# Altium schematic sheet Sheet2.SchDoc
size A4; SheetNumber: 2; SheetTotal: 2
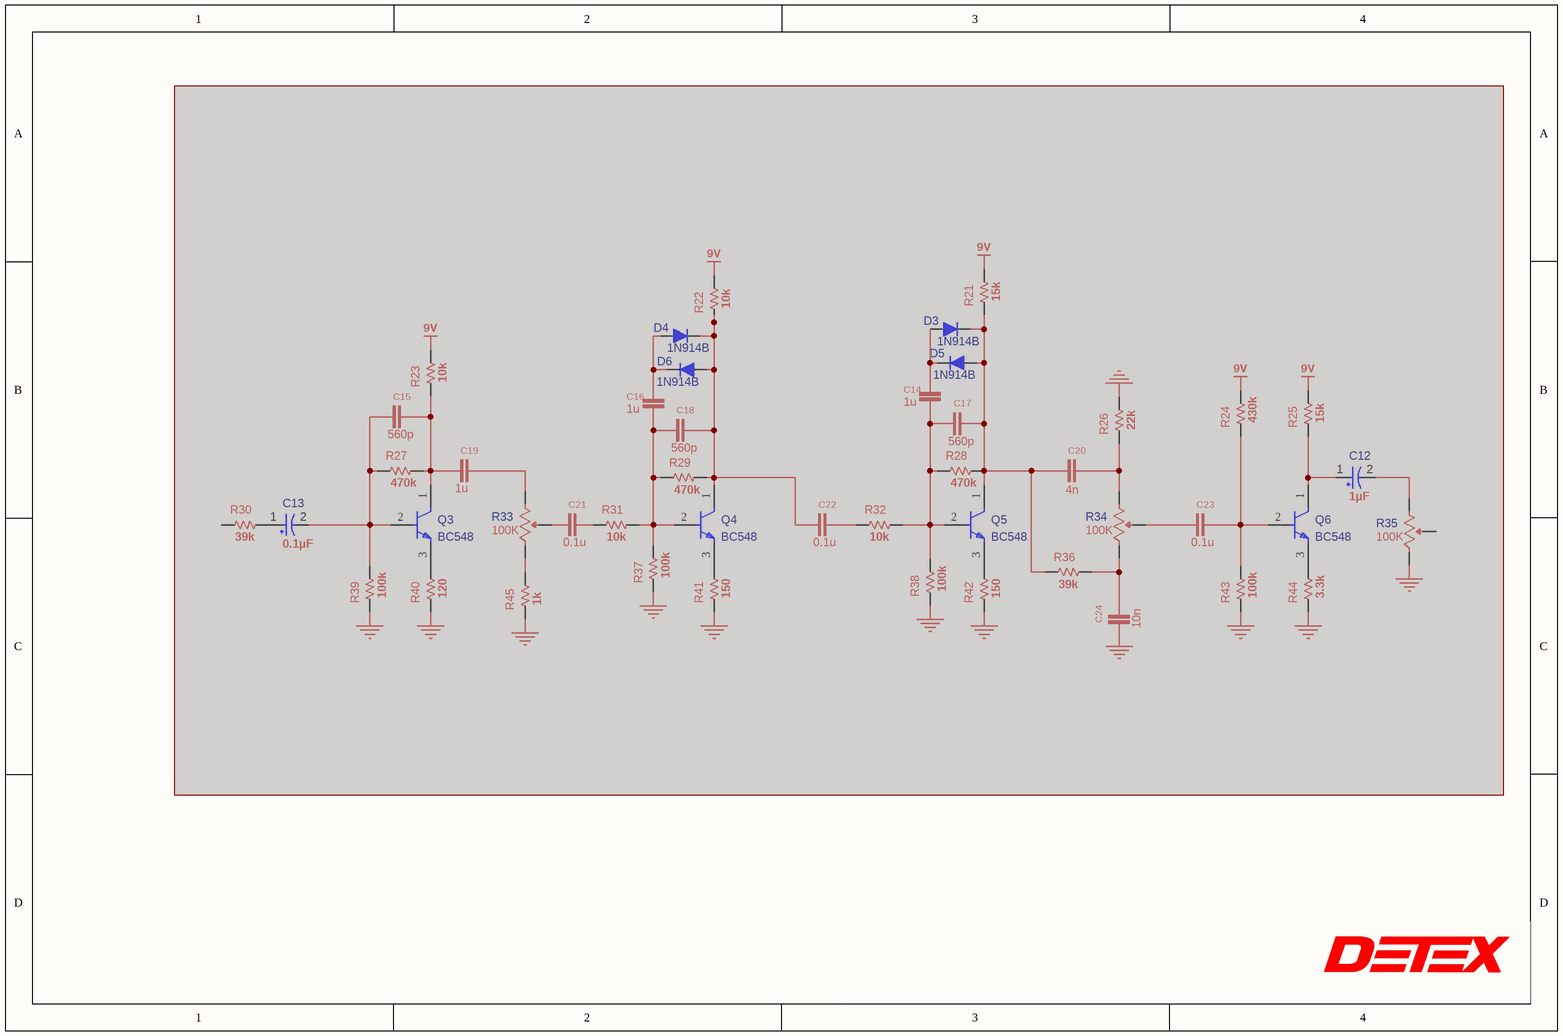
[diagram p0: Sheet2.SchDoc]

## Parts
C12  value 1µF  [CAPPR55-200-1100X500X1200]  (hidden comment: ECA-1HHG010)  (masked out: inside a compile mask, not in the netlist)
C13  value 0.1µF  [CAPPR55-200-1100X500X1200]  (hidden comment: ECA-1HHG010)  (masked out: inside a compile mask, not in the netlist)
C14  value 1u  [0805-R2013X50N]  (hidden comment: C-0805)  (masked out: inside a compile mask, not in the netlist)
C15  value 560p  [0805-R2013X50N]  (hidden comment: C-0805)  (masked out: inside a compile mask, not in the netlist)
C16  value 1u  [0805-R2013X50N]  (hidden comment: C-0805)  (masked out: inside a compile mask, not in the netlist)
C17  value 560p  [0805-R2013X50N]  (hidden comment: C-0805)  (masked out: inside a compile mask, not in the netlist)
C18  value 560p  [0805-R2013X50N]  (hidden comment: C-0805)  (masked out: inside a compile mask, not in the netlist)
C19  value 1u  [0805-R2013X50N]  (hidden comment: C-0805)  (masked out: inside a compile mask, not in the netlist)
C20  value 4n  [0805-R2013X50N]  (hidden comment: C-0805)  (masked out: inside a compile mask, not in the netlist)
C21  value 0.1u  [0805-R2013X50N]  (hidden comment: C-0805)  (masked out: inside a compile mask, not in the netlist)
C22  value 0.1u  [0805-R2013X50N]  (hidden comment: C-0805)  (masked out: inside a compile mask, not in the netlist)
C23  value 0.1u  [0805-R2013X50N]  (hidden comment: C-0805)  (masked out: inside a compile mask, not in the netlist)
C24  value 10n  [0805-R2013X50N]  (hidden comment: C-0805)  (masked out: inside a compile mask, not in the netlist)
D3  1N914B  [FP-017AG-MFG]  (masked out: inside a compile mask, not in the netlist)
D4  1N914B  [FP-017AG-MFG]  (masked out: inside a compile mask, not in the netlist)
D5  1N914B  [FP-017AG-MFG]  (masked out: inside a compile mask, not in the netlist)
D6  1N914B  [FP-017AG-MFG]  (masked out: inside a compile mask, not in the netlist)
Q3  BC548  [FP-135AR-MFG]  (masked out: inside a compile mask, not in the netlist)
Q4  BC548  [FP-135AR-MFG]  (masked out: inside a compile mask, not in the netlist)
Q5  BC548  [FP-135AR-MFG]  (masked out: inside a compile mask, not in the netlist)
Q6  BC548  [FP-135AR-MFG]  (masked out: inside a compile mask, not in the netlist)
R21  value 15k  [RESC_M-Footprint-1]  (hidden comment: RESC_0805)  (masked out: inside a compile mask, not in the netlist)
R22  value 10k  [RESC_M-Footprint-1]  (hidden comment: RESC_0805)  (masked out: inside a compile mask, not in the netlist)
R23  value 10k  [RESC_M-Footprint-1]  (hidden comment: RESC_0805)  (masked out: inside a compile mask, not in the netlist)
R24  value 430k  [RESC_M-Footprint-1]  (hidden comment: RESC_0805)  (masked out: inside a compile mask, not in the netlist)
R25  value 15k  [RESC_M-Footprint-1]  (hidden comment: RESC_0805)  (masked out: inside a compile mask, not in the netlist)
R26  value 22k  [RESC_M-Footprint-1]  (hidden comment: RESC_0805)  (masked out: inside a compile mask, not in the netlist)
R27  value 470k  [RESC_M-Footprint-1]  (hidden comment: RESC_0805)  (masked out: inside a compile mask, not in the netlist)
R28  value 470k  [RESC_M-Footprint-1]  (hidden comment: RESC_0805)  (masked out: inside a compile mask, not in the netlist)
R29  value 470k  [RESC_M-Footprint-1]  (hidden comment: RESC_0805)  (masked out: inside a compile mask, not in the netlist)
R30  value 39k  [RESC_M-Footprint-1]  (hidden comment: RESC_0805)  (masked out: inside a compile mask, not in the netlist)
R31  value 10k  [RESC_M-Footprint-1]  (hidden comment: RESC_0805)  (masked out: inside a compile mask, not in the netlist)
R32  value 10k  [RESC_M-Footprint-1]  (hidden comment: RESC_0805)  (masked out: inside a compile mask, not in the netlist)
R33  value 100K  [PDB241-GTR01-504A2-Footprint-1]  (hidden comment: PDB241-GTR01-504A2)  (masked out: inside a compile mask, not in the netlist)
R34  value 100K  [PDB241-GTR01-504A2-Footprint-1]  (hidden comment: PDB241-GTR01-504A2)  (masked out: inside a compile mask, not in the netlist)
R35  value 100K  [PDB241-GTR01-504A2-Footprint-1]  (hidden comment: PDB241-GTR01-504A2)  (masked out: inside a compile mask, not in the netlist)
R36  value 39k  [RESC_M-Footprint-1]  (hidden comment: RESC_0805)  (masked out: inside a compile mask, not in the netlist)
R37  value 100k  [RESC_M-Footprint-1]  (hidden comment: RESC_0805)  (masked out: inside a compile mask, not in the netlist)
R38  value 100k  [RESC_M-Footprint-1]  (hidden comment: RESC_0805)  (masked out: inside a compile mask, not in the netlist)
R39  value 100k  [RESC_M-Footprint-1]  (hidden comment: RESC_0805)  (masked out: inside a compile mask, not in the netlist)
R40  value 120  [RESC_M-Footprint-1]  (hidden comment: RESC_0805)  (masked out: inside a compile mask, not in the netlist)
R41  value 150  [RESC_M-Footprint-1]  (hidden comment: RESC_0805)  (masked out: inside a compile mask, not in the netlist)
R42  value 150  [RESC_M-Footprint-1]  (hidden comment: RESC_0805)  (masked out: inside a compile mask, not in the netlist)
R43  value 100k  [RESC_M-Footprint-1]  (hidden comment: RESC_0805)  (masked out: inside a compile mask, not in the netlist)
R44  value 3.3k  [RESC_M-Footprint-1]  (hidden comment: RESC_0805)  (masked out: inside a compile mask, not in the netlist)
R45  value 1k  [RESC_M-Footprint-1]  (hidden comment: RESC_0805)  (masked out: inside a compile mask, not in the netlist)

## Notes on the sheet
- Title:
- Engineer:
- Date:
- Number:
- Time:
- Revision:
- Sheet
- of
- 302 Detex Drive
- New Braunfels, TX 78130
- (830) 629-2900
- Detex Corp <detex.com>
- File Name:

## Library data of the parts
C12 C13 = CMP-001-00024-5: Aluminum Electrolytic Capacitor, 1 uF, +/- 20%, 50 V, -55 to 105 degC, 2-Pin THD, RoHS, Bulk; Manufacturer: Panasonic; Voltage Rating: 50V; Ripple Current: 10mA; Datasheet URL: https://datasheet.ciiva.com/7275/94060-7275472.pdf; Min Operating Temperature: -55°C; Case/Package: Radial; Package Reference: CAPPR55-200-1100X500X1200; Pins: 2; Lead Pitch: 2mm; Max Operating Temperature: 105°C; Diameter: 5mm; Capacitor Type: Electrolytic; Mounting Technology: TH; Datasheet Version: Mar-05; Package Description: 2-Pin Radial Lead, Dia 5 mm, Height 12 mm; Ripple Current (AC): 10mA; RoHS Compliant: True; Packaging: Bulk; Package Quantity: 200; Manufacturer URL: http://www.panasonic.com/; Tolerance: 20%
C14-C24 = CMP-102-000002-3: SMD Capacitor; MANUFACTURER-PN: C0805C472KDRACTU; MANUFACTURER: Kemet; CODE-ARDUINO: 0689; DeviceSetName: C; DeviceName: -0805; GateName_1: G$1; Tolerance: 10%; Mounting Technology: Surface Mount; LibraryName: Arduino-rcl; DISTRIBUTOR-LINK: www.kemet.com/docfinder?Partnumber=C0805C472KDRACTU; DISTRIBUTOR-PN: 399-6738-1-ND; Design Item ID: C-0805; Detex P/N: *; Source: e.SCHLIB; Pins: 2; NOTE: -; DATASHEET: http://www.kemet.com/Lists/ProductCatalog/Attachments/40/KEM_C1010_X7R_HV_SMD.pdf; SymbolName_1: C
D3-D6 = DIODE-00001-1: onsemi Rectifier diode Diodes, 300mA, 100V, Through hole mounting, DO-35encapsulation, 2needle; Power Dissipation: 500mW; Reverse Recovery Time: 4ns; Forward Voltage: 620mV; Max Forward Surge Current (Ifsm): 2A; Peak Reverse Current: 5µA; Peak Non-Repetitive Surge Current: 4A; Value: 4pF; Output Current: 200mA; Min Operating Temperature: -55°C; Reverse Voltage: 100V; Max Operating Temperature: 150°C; Case/Package: DO-213AB; Pins: 2; Mounting Technology: Through Hole; Forward Current: 300mA; Max Reverse Voltage (DC): 100V; Detex P/N: *; Max Surge Current: 4A
Q3-Q6 = TRAN-00002-1: Small Signal Bipolar Transistor, 0.1A I(C), 30V V(BR)CEO, 1-Element, NPN, Silicon, TO-92; Max Power Dissipation: 500mW; Gain Bandwidth Product: 300MHz; Max Collector Current: 100mA; Collector Emitter Saturation Voltage: 600mV; Collector Base Voltage (VCBO): 30V; Power Dissipation: 500mW; Max Breakdown Voltage: 30V; Pins: 3; Collector Emitter Voltage (VCEO): 30V; Max Operating Temperature: 150°C; Min Operating Temperature: -65°C; Case/Package: TO-92; Collector Emitter Breakdown Voltage: 30V; Detex P/N: *; Current Rating: 100mA; Width: 3.86mm; Mounting Technology: Through Hole
R21-R32 R36-R45 = CMP-009-00178-2: 0805 SMT Resistor; Tolerance: 5%; Technology: Thick film; Case/Package: 0805
R33-R35 = CMP-009-00248-2: Potentiometer Carbon Guitar 500 Kohms Knurled Shaft Solderlugs PDB241-GTR Series; Number of Turns: 1; Voltage Rating: 250V; Actuator Length: 18.9992mm; Tolerance: 20%; Power Rating: 250mW; Actuator Diameter: 5.9944mm; Hole Diameter: 9.525mm; Termination: Solder; Length: 30.5mm; Diameter: 24mm; Height: 28mm; Taper: Audio; Mounting Technology: Panel; Depth: 24mm; Min Operating Temperature: -10°C; Max Operating Temperature: 70°C